# Altium schematic sheet УШЯИ.411618.029Э Э3 Лист 5new.schdoc
size 594 x 420 mm; SheetNumber: 5; SheetTotal: 7
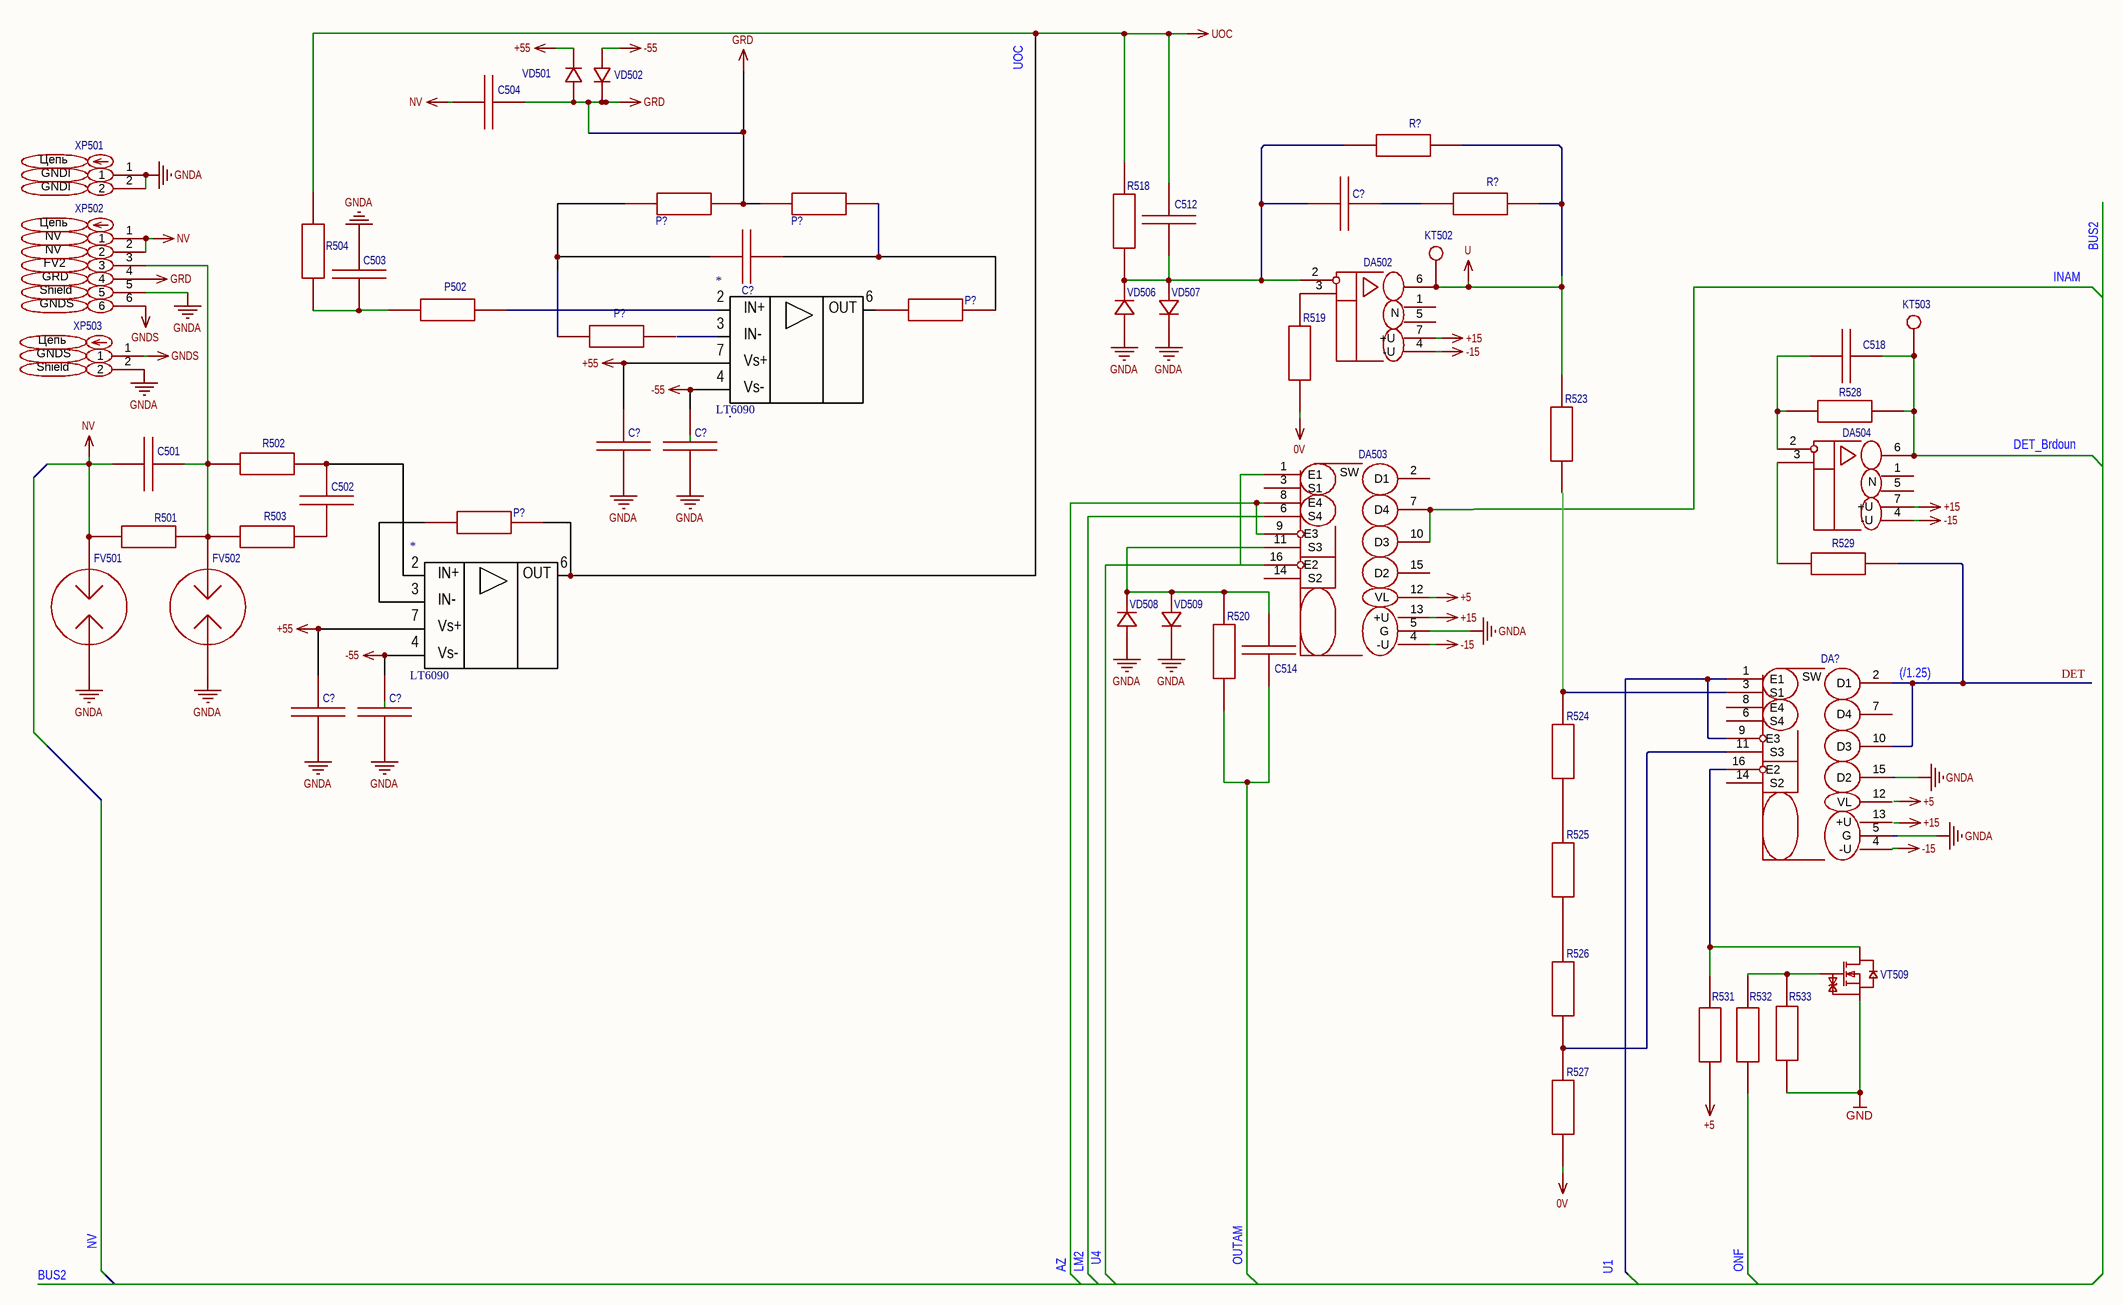
[diagram p0: УШЯИ.411618.029Э Э3 Лист 5new.schdoc]

## Parts
(Parts that share a designator on the sheet are numbered #1, #2 ... from top to bottom, then left to right.)
*#1  LT6090
*#2  LT6090
C501  Конденсатор К10-17Б М47 47пФ  NP0 5% [DIP]  [Конденсатор К10-17Б М47 X.X.xФ  NP0 5% [DIP 8мм]]  (value not drawn)
C502  Конденсатор К10-17Б М47 47пФ  NP0 5% [DIP]  [Конденсатор К10-17Б М47 X.X.xФ  NP0 5% [DIP 8мм]]  (value not drawn)
C503  Конденсатор SMD 10пФ 100В X7R 10% [0805]  [C0805]  (value not drawn)
C504  Конденсатор К10-17Б М47 0,022мкФ  NP0 5% [DIP]  [Конденсатор К10-17Б М47 X.X.xФ  NP0 5% [DIP 5мм]]  (value not drawn)
C512  Конденсатор SMD 10пФ 100В X7R 10% [0805]  [C0805]  (value not drawn)
C514  Конденсатор SMD 1500пФ 100В X7R 10% [0805]  [C0805]  (value not drawn)
C518  Конденсатор SMD 33пФ 100В X7R 10% [0805]  [C0805]  (value not drawn)
C?#1  Конденсатор SMD 100пФ 100В X7R 10% [0805]  [C0805]  (value not drawn)
C?#2  Конденсатор К10-17Б М47 47пФ  NP0 5% [DIP]  [Конденсатор К10-17Б М47 X.X.xФ  NP0 5% [DIP 8мм]]  (value not drawn)
C?#3  Конденсатор К10-17Б М47 47пФ  NP0 5% [DIP]  [Конденсатор К10-17Б М47 X.X.xФ  NP0 5% [DIP 8мм]]  (value not drawn)
C?#4  Конденсатор К10-17Б М47 47пФ  NP0 5% [DIP]  [Конденсатор К10-17Б М47 X.X.xФ  NP0 5% [DIP 8мм]]  (value not drawn)
C?#5  Конденсатор К10-17Б М47 47пФ  NP0 5% [DIP]  [Конденсатор К10-17Б М47 X.X.xФ  NP0 5% [DIP 8мм]]  (value not drawn)
C?#6  Конденсатор К10-17Б М47 47пФ  NP0 5% [DIP]  [Конденсатор К10-17Б М47 X.X.xФ  NP0 5% [DIP 8мм]]  (value not drawn)
DA502  Операционный усилитель ADA4627-1BRZ [SOIC-8]  [SOIC-8_L5.0-W4.0-P1.27-LS6.1-BL]  (value not drawn)
DA503  Коммутатор аналоговых сигналов ADG433BRZ [SOIC-16]  [SOIC-16_L9.9-W3.9-P1.27-LS6.0-BL]  (value not drawn)
DA504  Операционный усилитель ADA4627-1BRZ [SOIC-8]  [SOIC-8_L5.0-W4.0-P1.27-LS6.1-BL]  (value not drawn)
DA?  Коммутатор аналоговых сигналов ADG433BRZ [SOIC-16]  [SOIC-16_L9.9-W3.9-P1.27-LS6.0-BL]  (value not drawn)
FV501  Разрядник газонаполненный B88069-X8870-B502 (A81-C90X)  (value not drawn)
FV502  Разрядник газонаполненный B88069-X8870-B502 (A81-C90X)  (value not drawn)
KT502  Control point  (value not drawn)
KT503  Control point  (value not drawn)
P502  Перемычка  [R0805]  (value not drawn)
P?#1  Перемычка  [R0805]  (value not drawn)
P?#2  Перемычка  [R0805]  (value not drawn)
P?#3  Резистор 100Ом 0,25Вт 1% [1206]  [R0805]  (value not drawn)
P?#4  Перемычка  [R0805]  (value not drawn)
P?#5  Резистор 100Ом 0,25Вт 1% [1206]  [R0805]  (value not drawn)
R501  Резистор C2-29В-0,25 1,2кОм ±0,5% [DIP]  (value not drawn)
R502  Резистор C2-29В-0,25 301кОм ±0,5% [DIP]  (value not drawn)
R503  Резистор C2-29В-0,25 5.1кОм ±0,5% [DIP]  (value not drawn)
R504  Резистор 91кОм 0,125Вт 1% [0805]  [R0805]  (value not drawn)
R518  Резистор 40,2кОм 0.25Вт 1% [1206]  [R0805]  (value not drawn)
R519  Резистор 15кОм 0,125Вт 1% [0805]  [R0805]  (value not drawn)
R520  Резистор 200кОм 0,125Вт 1% [0805]  [R0805]  (value not drawn)
R523  Резистор 4,02кОм 0.25Вт 1% [1206]  [R1206]  (value not drawn)
R524  Резистор 4,02кОм 0.25Вт 1% [1206]  [R1206]  (value not drawn)
R525  Резистор 4,02кОм 0.25Вт 1% [1206]  [R1206]  (value not drawn)
R526  Резистор 4,02кОм 0.25Вт 1% [1206]  [R1206]  (value not drawn)
R527  Резистор 4,02кОм 0.25Вт 1% [1206]  [R1206]  (value not drawn)
R528  Резистор 3,6кОм 0,125Вт 1% [0805]  [R0805]  (value not drawn)
R529  Резистор 110кОм 0,125Вт 1% [0805]  [R0805]  (value not drawn)
R531  Резистор 5,3кОм 0,125Вт 1% [0805]  [R0805]  (value not drawn)
R532  Резистор 100Ом 0,125Вт 1% [0805]  [R0805]  (value not drawn)
R533  Резистор 100Ом 0,125Вт 1% [0805]  [R0805]  (value not drawn)
R?#1  Резистор 10кОм 0,125Вт 1% [0805]  [R0805]  (value not drawn)
R?#2  Резистор 10кОм 0,125Вт 1% [0805]  [R0805]  (value not drawn)
VD501  Диод импульсный 1N4448 [DO-35]  [DO-35_BD2.0-L4.2-P8.20-D0.5-RD]  (value not drawn)
VD502  Диод импульсный 1N4448 [DO-35]  [DO-35_BD2.0-L4.2-P8.20-D0.5-RD]  (value not drawn)
VD506  Диод импульсный 1N4448 [SOD-123]  [SOD-123_L2.7-W1.6-LS3.7-RD-1]  (value not drawn)
VD507  Диод импульсный 1N4448 [SOD-123]  [SOD-123_L2.7-W1.6-LS3.7-RD-1]  (value not drawn)
VD508  Диод импульсный 1N4448 [SOD-123]  [SOD-123_L2.7-W1.6-LS3.7-RD-1]  (value not drawn)
VD509  Диод импульсный 1N4448 [SOD-123]  [SOD-123_L2.7-W1.6-LS3.7-RD-1]  (value not drawn)
VT509  Транзистор полевой MOSFET N-канальный BSS138BK [SOT-23-3]  [SOT-23-3_L2.9-W1.3-P1.90-LS2.4-BR]  (value not drawn)
XP501  Вилка на плату 280370-2 шаг 2.54мм  [CONN-TH_280370-2]  (value not drawn)
XP502  Вилка на плату 280372-1 шаг 2.54мм  [CONN-TH_280372-1]  (value not drawn)
XP503  Вилка на плату 280370-2 шаг 2.54мм  [CONN-TH_280370-2]  (value not drawn)

## Nets
0V: R519.1 R527.1
+5: DA503.12(VL) R531.1
+15: DA502.7(+U) DA503.13(+U) DA504.7(+U)
+55: *#1.13 *#2.13 C?#3.1 C?#5.1 VD501.1
-15: DA502.4(-U) DA503.4(-U) DA504.4(-U)
-55: *#1.14 *#2.14 C?#4.1 C?#6.1 VD502.2
GND: R533.1 VT509.2(S)
GNDA: C503.2 C?#3.2 C?#4.2 C?#5.2 C?#6.2 DA503.5(G) DA?.5(G) DA?.15(D2) FV501.2 FV502.2 VD506.2(A) VD507.1(C) VD508.2(A) VD509.1(C) XP501.1 XP501.2 XP502.5 XP503.2
GNDS: XP502.6 XP503.1
GRD: C504.2 P?#1.1 P?#2.2 VD501.2 VD502.1 XP502.4
NV: C501.2 C504.1 FV501.1 R501.1 XP502.1 XP502.2
U: DA502.6(OUT) KT502.1 R523.2 R?#1.2 R?#2.2
UOC: *#2.7 C512.2 P?#5.1 R504.2 R518.1
AZ: DA503.8(E4) DA503.9(E3)
LM2: DA503.6(S4)
ONF: R532.1
OUTAM: C514.1 R520.2
U4: DA503.1(E1) DA503.16(E2)
Net*#1_7: *#1.7 P?#3.2
Net*#1_11: *#1.11 P502.1
Net*#2_11: *#2.11 C502.1 R502.2
Net*#2_12: *#2.12 P?#5.2
NetC501_1: C501.1 FV502.1 R501.2 R502.1 R503.1 XP502.3
NetC502_2: C502.2 R503.2
NetC503_1: C503.1 P502.2 R504.1
NetC512_1: C512.1 C?#1.2 DA502.2(-IN) R518.2 R?#1.1 VD506.1(C) VD507.2(A)
NetC514_2: C514.2 DA503.11(S3) R520.1 VD508.1(C) VD509.2(A)
NetC518_1: C518.1 DA504.2(-IN) R528.2
NetC518_2: C518.2 DA504.6(OUT) KT503.1 R528.1
NetC?#1_1: C?#1.1 R?#2.1
NetC?#2_1: C?#2.1 P?#1.2 P?#4.2
NetC?#2_2: C?#2.2 P?#2.1 P?#3.1
NetDA502_3: DA502.3(+IN) R519.2
NetDA503_7: DA503.7(D4) DA503.10(D3)
NetDA504_3: DA504.3(+IN) R529.2
NetDA?_1: DA?.1(E1) DA?.9(E3)
NetDA?_2: DA?.2(D1) DA?.10(D3) R529.1
NetDA?_3: DA?.3(S1) R523.1 R524.2
NetDA?_11: DA?.11(S3) R526.1 R527.2
NetDA?_16: DA?.16(E2) R531.2 VT509.3(D)
NetR524_1: R524.1 R525.2
NetR525_1: R525.1 R526.2
NetR532_2: R532.2 R533.2 VT509.1(G)

Not connected (* = marked no-connect by the designer): *#1 12; DA502 1(N) 5(N); DA503 2(D1) 3(S1) 14(S2) 15(D2); DA504 1(N) 5(N); DA? 4(-U) 6(S4) 7(D4) 8(E4) 12(VL) 13(+U) 14(S2); P?#4 1

## Buses and harness runs
bus BUS2

## Notes on the sheet
- GNDI
- NV
- GNDS
- (near XP502) Shield
- (near XP502) GRD
- (near XP502) FV2
- (near XP503) Shield
- Labels drawn without touching a wire or pin: (/1.25), DET, DET_Brdoun, INAM, U1, UOC
- Подп. и дата
- Инв.№ дубл.
- Взам.инв.№
- Подп.и дата
- Инв.№ подл.
- Изм.
- Лист
- № докум.
- Подп.
- Дата
- Формат  A2
- (in symbol LT6090) 2; 6; IN+; OUT; 3; IN-; Vs+; 4; Vs-
- (in symbol Вилка на плату 280370-2 шаг 2.54мм) Цепь
- (in symbol Вилка на плату 280372-1 шаг 2.54мм) Цепь
- (in symbol Коммутатор аналоговых сигналов ADG433BRZ [SOIC-16]) SW

## Library data of the parts
C501 = Конденсатор К10-17Б М47 47пФ  NP0 5% [DIP]: Contributor: jordanjin; Convert to PCB: yes; UniqueId: gge491fe3ed6471c83b; Origin Footprint: К10-17Б М47; Device: Конденсатор К10-17Б М47 47пФ  NP0 5% [DIP]; Symbol: Конденсатор К10-17Б М47 47пФ  NP0 5% [DIP]; Manufacturer Part: К10-17Б М47; Add into BOM: yes; spicePre: C; spiceSymbolName: Конденсатор К10-17Б М47 33пФ NP0 5% [DIP]
C502 C?#2-C?#6 = Конденсатор К10-17Б М47 47пФ  NP0 5% [DIP]: Contributor: jordanjin; Convert to PCB: yes; UniqueId: gge052eea8d6ff6ddb1; Origin Footprint: К10-17Б М47; Device: Конденсатор К10-17Б М47 47пФ  NP0 5% [DIP]; Symbol: Конденсатор К10-17Б М47 47пФ  NP0 5% [DIP]; Manufacturer Part: К10-17Б М47; Add into BOM: yes; spicePre: C; spiceSymbolName: Конденсатор К10-17Б М47 33пФ NP0 5% [DIP]
C503 = Конденсатор SMD 10пФ 100В X7R 10% [0805]: Contributor: jordanjin; Convert to PCB: yes; UniqueId: gge9d51e8d6ddafb28b; Origin Footprint: C0805; Device: Конденсатор SMD 10пФ 100В X7R 10% [0805]; Symbol: Конденсатор SMD 10пФ 100В X7R 10% [0805]; Manufacturer Part: C0805; Add into BOM: yes; spicePre: C; spiceSymbolName: Конденсатор SMD 100нФ 100В X7R 10% [0805]; FootprintName: C0805
C504 = Конденсатор К10-17Б М47 0,022мкФ  NP0 5% [DIP]: Contributor: jordanjin; Convert to PCB: yes; UniqueId: ggef415597d1a4119d4; Origin Footprint: К10-17Б М47; Device: Конденсатор К10-17Б М47 0,022мкФ  NP0 5% [DIP]; Symbol: Конденсатор К10-17Б М47 0,022мкФ  NP0 5% [DIP]; Manufacturer Part: К10-17Б М47; Add into BOM: yes; spicePre: C; spiceSymbolName: Конденсатор К10-17Б М47 33пФ NP0 5% [DIP]
C512 = Конденсатор SMD 10пФ 100В X7R 10% [0805]: Contributor: jordanjin; Convert to PCB: yes; UniqueId: ggebd9749fa172219f8; Origin Footprint: C0805; Device: Конденсатор SMD 10пФ 100В X7R 10% [0805]; Symbol: Конденсатор SMD 10пФ 100В X7R 10% [0805]; Manufacturer Part: C0805; Add into BOM: yes; spicePre: C; spiceSymbolName: Конденсатор SMD 100нФ 100В X7R 10% [0805]; FootprintName: C0805
C514 = Конденсатор SMD 1500пФ 100В X7R 10% [0805]: Contributor: jordanjin; Convert to PCB: yes; UniqueId: ggeffbae3697dc6129d; Origin Footprint: C0805; Device: Конденсатор SMD 1500пФ 100В X7R 10% [0805]; Symbol: Конденсатор SMD 1500пФ 100В X7R 10% [0805]; Manufacturer Part: C0805; Add into BOM: yes; spicePre: C; spiceSymbolName: Конденсатор SMD 100нФ 100В X7R 10% [0805]; FootprintName: C0805
C518 = Конденсатор SMD 33пФ 100В X7R 10% [0805]: Contributor: jordanjin; Convert to PCB: yes; UniqueId: ggeb634362126cd7a9d; Origin Footprint: C0805; Device: Конденсатор SMD 33пФ 100В X7R 10% [0805]; Symbol: Конденсатор SMD 33пФ 100В X7R 10% [0805]; Manufacturer Part: C0805; Add into BOM: yes; spicePre: C; spiceSymbolName: Конденсатор SMD 100нФ 100В X7R 10% [0805]; FootprintName: C0805
C?#1 = Конденсатор SMD 100пФ 100В X7R 10% [0805]: Contributor: jordanjin; Convert to PCB: yes; UniqueId: gge9bc8ec9642d03d6f; Origin Footprint: C0805; Device: Конденсатор SMD 100пФ 100В X7R 10% [0805]; Symbol: Конденсатор SMD 100пФ 100В X7R 10% [0805]; Manufacturer Part: C0805; Add into BOM: yes; spicePre: C; spiceSymbolName: Конденсатор SMD 100нФ 100В X7R 10% [0805]; FootprintName: C0805
DA502 = Операционный усилитель ADA4627-1BRZ [SOIC-8]: Manufacturer: Analog Devices; Contributor: jordanjin; Convert to PCB: yes; UniqueId: gge3bbaef5c86713b63; ModelId: 08ee08ca4db744298953d7a1ad16709b; Origin Footprint: SOIC-8_L5.0-W4.0-P1.27-LS6.1-BL; Device: Операционный усилитель ADA4627-1BRZ [SOIC-8]; Symbol: Операционный усилитель ADA4627-1BRZ [SOIC-8]; Supplier: LCSC; Manufacturer Part: ADA4627-1BRZ; JLCPCB Part Class: Extended Part; spicePre: D; spiceSymbolName: Операционный усилитель ADA4627-1BRZ [SOIC-8]; Add into BOM: yes; FootprintName: SOIC-8_L5.0-W4.0-P1.27-LS6.1-BL; ModelName: SOIC-8_L5.0-W4.0-P1.27-LS6.1-BL
DA503 DA? = Коммутатор аналоговых сигналов ADG433BRZ [SOIC-16]: Manufacturer: Analog Devices; Manufacturer Part: ADG433BRZ-REEL; Contributor: jordanjin; Convert to PCB: yes; UniqueId: gge812f241916226e6f; Origin Footprint: SOIC-16_L9.9-W3.9-P1.27-LS6.0-BL; Device: Коммутатор аналоговых сигналов ADG433BRZ [SOIC-16]; Symbol: Коммутатор аналоговых сигналов ADG433BRZ [SOIC-16]; Supplier: LCSC; Supplier Part: C655338; JLCPCB Part Class: Extended Part; spicePre: D; spiceSymbolName: Коммутатор аналоговых сигналов ADG433BRZ [SOIC-16]; Add into BOM: yes; FootprintName: SOIC-16_L9.9-W3.9-P1.27-LS6.0-BL
DA504 = Операционный усилитель ADA4627-1BRZ [SOIC-8]: Manufacturer: Analog Devices; Contributor: jordanjin; Convert to PCB: yes; UniqueId: gge3cb18010d39f84ed; ModelId: 08ee08ca4db744298953d7a1ad16709b; Origin Footprint: SOIC-8_L5.0-W4.0-P1.27-LS6.1-BL; Device: Операционный усилитель ADA4627-1BRZ [SOIC-8]; Symbol: Операционный усилитель ADA4627-1BRZ [SOIC-8]; Supplier: LCSC; Manufacturer Part: ADA4627-1BRZ; JLCPCB Part Class: Extended Part; spicePre: D; spiceSymbolName: Операционный усилитель ADA4627-1BRZ [SOIC-8]; Add into BOM: yes; FootprintName: SOIC-8_L5.0-W4.0-P1.27-LS6.1-BL; ModelName: SOIC-8_L5.0-W4.0-P1.27-LS6.1-BL
FV501 = Разрядник газонаполненный B88069-X8870-B502 (A81-C90X): Manufacturer: TDK/EPCOS; Contributor: jordanjin; Convert to PCB: yes; UniqueId: gge7d0c9ba83060bbcb; Origin Footprint: B88069-X8870-B502 (A81-C90X); Device: Разрядник газонаполненный B88069-X8870-B502 (A81-C90X); Symbol: Разрядник газонаполненный B88069-X8870-B502 (A81-C90X); Manufacturer Part: B88069-X8870-B502 (A81-C90X); spicePre: F; spiceSymbolName: Разрядник газонаполненный B88069-X8870-B502 (A81-C90X); Add into BOM: yes
FV502 = Разрядник газонаполненный B88069-X8870-B502 (A81-C90X): Manufacturer: TDK/EPCOS; Contributor: jordanjin; Convert to PCB: yes; UniqueId: gge3e96f04a3a81286c; Origin Footprint: B88069-X8870-B502 (A81-C90X); Device: Разрядник газонаполненный B88069-X8870-B502 (A81-C90X); Symbol: Разрядник газонаполненный B88069-X8870-B502 (A81-C90X); Manufacturer Part: B88069-X8870-B502 (A81-C90X); spicePre: F; spiceSymbolName: Разрядник газонаполненный B88069-X8870-B502 (A81-C90X); Add into BOM: yes
KT502 = Control point: Contributor: jordanjin; Convert to PCB: yes; UniqueId: gge744cfcad2b49a33b; Origin Footprint: CONTROL POINT; Device: Control point; Symbol: Control point; Manufacturer Part: Control point; spicePre: K; spiceSymbolName: Control point; Add into BOM: yes
KT503 = Control point: Contributor: jordanjin; Convert to PCB: yes; UniqueId: gge87ec17736d97cc32; Origin Footprint: CONTROL POINT; Device: Control point; Symbol: Control point; Manufacturer Part: Control point; spicePre: K; spiceSymbolName: Control point; Add into BOM: yes
P502 P?#4 = Перемычка: Contributor: jordanjin; Convert to PCB: yes; UniqueId: gge573c0a9b40f3e6e7; ModelId: de27d504f5024d53a3020ec2611f5e5e; Origin Footprint: R0805; Device: Перемычка; Symbol: Перемычка; Manufacturer Part: R0805; spicePre: R; spiceSymbolName: Резистор 12кОм 0,125Вт 1% [0805]; Add into BOM: yes; FootprintName: R0805; ModelName: R0805
P?#1 P?#2 = Перемычка: Contributor: jordanjin; Convert to PCB: yes; UniqueId: ggece0821aceddbed5f; ModelId: de27d504f5024d53a3020ec2611f5e5e; Origin Footprint: R0805; Device: Перемычка; Symbol: Перемычка; Manufacturer Part: R0805; spicePre: R; spiceSymbolName: Резистор 12кОм 0,125Вт 1% [0805]; Add into BOM: yes; FootprintName: R0805; ModelName: R0805
P?#3 P?#5 = Перемычка: Contributor: jordanjin; Convert to PCB: yes; UniqueId: gge82243ce5db2e3be1; ModelId: de27d504f5024d53a3020ec2611f5e5e; Origin Footprint: R0805; Device: Перемычка; Symbol: Перемычка; Manufacturer Part: R0805; spicePre: R; spiceSymbolName: Резистор 12кОм 0,125Вт 1% [0805]; Add into BOM: yes; FootprintName: R0805; ModelName: R0805
R501 = Резистор C2-29В-0,25 1,2кОм ±0,5% [DIP]: Contributor: jordanjin; Convert to PCB: yes; UniqueId: ggee93e24d1da7ce645; Origin Footprint: C2-29В-0,25; Device: Резистор C2-29В-0,25 1,2кОм ±0,5% [DIP]; Symbol: Резистор C2-29В-0,25 1,2кОм ±0,5% [DIP]; Manufacturer Part: C2-29В-0,25; spicePre: R; spiceSymbolName: Резистор C2-29В-0,25 1 МОм ±0,5% [DIP]; Add into BOM: yes
R502 = Резистор C2-29В-0,25 301кОм ±0,5% [DIP]: Contributor: jordanjin; Convert to PCB: yes; UniqueId: ggeaa02f2f272a77a31; Origin Footprint: C2-29В-0,25; Device: Резистор C2-29В-0,25 301кОм ±0,5% [DIP]; Symbol: Резистор C2-29В-0,25 301кОм ±0,5% [DIP]; Manufacturer Part: C2-29В-0,25; spicePre: R; spiceSymbolName: Резистор C2-29В-0,25 1 МОм ±0,5% [DIP]; Add into BOM: yes
R503 = Резистор C2-29В-0,25 5.1кОм ±0,5% [DIP]: Contributor: jordanjin; Convert to PCB: yes; UniqueId: gge30d652682c4d8343; Origin Footprint: C2-29В-0,25; Device: Резистор C2-29В-0,25 5.1кОм ±0,5% [DIP]; Symbol: Резистор C2-29В-0,25 5.1кОм ±0,5% [DIP]; Manufacturer Part: C2-29В-0,25; spicePre: R; spiceSymbolName: Резистор C2-29В-0,25 1 МОм ±0,5% [DIP]; Add into BOM: yes
R504 = Резистор 91кОм 0,125Вт 1% [0805]: Contributor: jordanjin; Convert to PCB: yes; UniqueId: ggeca5f87feb20cb38d; ModelId: de27d504f5024d53a3020ec2611f5e5e; Origin Footprint: R0805; Device: Резистор 91кОм 0,125Вт 1% [0805]; Symbol: Резистор 91кОм 0,125Вт 1% [0805]; Manufacturer Part: R0805; spicePre: R; spiceSymbolName: Резистор 12кОм 0,125Вт 1% [0805]; Add into BOM: yes; FootprintName: R0805; ModelName: R0805
R518 = Резистор 40,2кОм 0.25Вт 1% [1206]: Contributor: jordanjin; Convert to PCB: yes; UniqueId: gge080981316cda412b; ModelId: de27d504f5024d53a3020ec2611f5e5e; Origin Footprint: R0805; Device: Резистор 40,2кОм 0.25Вт 1% [1206]; Symbol: Резистор 40,2кОм 0.25Вт 1% [1206]; Manufacturer Part: R0805; spicePre: R; spiceSymbolName: Резистор 12кОм 0,125Вт 1% [0805]; Add into BOM: yes; FootprintName: R0805; ModelName: R0805
R519 = Резистор 15кОм 0,125Вт 1% [0805]: Contributor: jordanjin; Convert to PCB: yes; UniqueId: ggee26b7d08d16a2d39; ModelId: de27d504f5024d53a3020ec2611f5e5e; Origin Footprint: R0805; Device: Резистор 15кОм 0,125Вт 1% [0805]; Symbol: Резистор 15кОм 0,125Вт 1% [0805]; Manufacturer Part: R0805; spicePre: R; spiceSymbolName: Резистор 12кОм 0,125Вт 1% [0805]; Add into BOM: yes; FootprintName: R0805; ModelName: R0805
R520 = Резистор 200кОм 0,125Вт 1% [0805]: Contributor: jordanjin; Convert to PCB: yes; UniqueId: gge3d1eef37f3680d67; ModelId: de27d504f5024d53a3020ec2611f5e5e; Origin Footprint: R0805; Device: Резистор 200кОм 0,125Вт 1% [0805]; Symbol: Резистор 200кОм 0,125Вт 1% [0805]; Manufacturer Part: R0805; spicePre: R; spiceSymbolName: Резистор 12кОм 0,125Вт 1% [0805]; Add into BOM: yes; FootprintName: R0805; ModelName: R0805
R523 = Резистор 4,02кОм 0.25Вт 1% [1206]: Contributor: jordanjin; Convert to PCB: yes; UniqueId: gge14753fe53ea0679b; Origin Footprint: R1206; Device: Резистор 4,02кОм 0.25Вт 1% [1206]; Symbol: Резистор 4,02кОм 0.25Вт 1% [1206]; Manufacturer Part: R1206; spicePre: R; spiceSymbolName: Резистор 12кОм 0,25Вт 1% [1206]; Add into BOM: yes; FootprintName: R1206
R524 = Резистор 4,02кОм 0.25Вт 1% [1206]: Contributor: jordanjin; Convert to PCB: yes; UniqueId: gge013a5ba9a346bf91; Origin Footprint: R1206; Device: Резистор 4,02кОм 0.25Вт 1% [1206]; Symbol: Резистор 4,02кОм 0.25Вт 1% [1206]; Manufacturer Part: R1206; spicePre: R; spiceSymbolName: Резистор 12кОм 0,25Вт 1% [1206]; Add into BOM: yes; FootprintName: R1206
R525 = Резистор 4,02кОм 0.25Вт 1% [1206]: Contributor: jordanjin; Convert to PCB: yes; UniqueId: ggeee7ff1649821f986; Origin Footprint: R1206; Device: Резистор 4,02кОм 0.25Вт 1% [1206]; Symbol: Резистор 4,02кОм 0.25Вт 1% [1206]; Manufacturer Part: R1206; spicePre: R; spiceSymbolName: Резистор 12кОм 0,25Вт 1% [1206]; Add into BOM: yes; FootprintName: R1206
R526 = Резистор 4,02кОм 0.25Вт 1% [1206]: Contributor: jordanjin; Convert to PCB: yes; UniqueId: gge439789adcec64be8; Origin Footprint: R1206; Device: Резистор 4,02кОм 0.25Вт 1% [1206]; Symbol: Резистор 4,02кОм 0.25Вт 1% [1206]; Manufacturer Part: R1206; spicePre: R; spiceSymbolName: Резистор 12кОм 0,25Вт 1% [1206]; Add into BOM: yes; FootprintName: R1206
R527 = Резистор 4,02кОм 0.25Вт 1% [1206]: Contributor: jordanjin; Convert to PCB: yes; UniqueId: gge8942019ccbc340b8; Origin Footprint: R1206; Device: Резистор 4,02кОм 0.25Вт 1% [1206]; Symbol: Резистор 4,02кОм 0.25Вт 1% [1206]; Manufacturer Part: R1206; spicePre: R; spiceSymbolName: Резистор 12кОм 0,25Вт 1% [1206]; Add into BOM: yes; FootprintName: R1206
R528 = Резистор 3,6кОм 0,125Вт 1% [0805]: Contributor: jordanjin; Convert to PCB: yes; UniqueId: gge6ded2c844e8eef63; ModelId: de27d504f5024d53a3020ec2611f5e5e; Origin Footprint: R0805; Device: Резистор 3,6кОм 0,125Вт 1% [0805]; Symbol: Резистор 3,6кОм 0,125Вт 1% [0805]; Manufacturer Part: R0805; spicePre: R; spiceSymbolName: Резистор 12кОм 0,125Вт 1% [0805]; Add into BOM: yes; FootprintName: R0805; ModelName: R0805
R529 = Резистор 110кОм 0,125Вт 1% [0805]: Contributor: jordanjin; Convert to PCB: yes; UniqueId: gge0039357b24a0ea0d; ModelId: de27d504f5024d53a3020ec2611f5e5e; Origin Footprint: R0805; Device: Резистор 110кОм 0,125Вт 1% [0805]; Symbol: Резистор 110кОм 0,125Вт 1% [0805]; Manufacturer Part: R0805; spicePre: R; spiceSymbolName: Резистор 12кОм 0,125Вт 1% [0805]; Add into BOM: yes; FootprintName: R0805; ModelName: R0805
R531 = Резистор 5,3кОм 0,125Вт 1% [0805]: Contributor: jordanjin; Convert to PCB: yes; UniqueId: ggedcd3b63f08ea3a0a; ModelId: de27d504f5024d53a3020ec2611f5e5e; Origin Footprint: R0805; Device: Резистор 5,3кОм 0,125Вт 1% [0805]; Symbol: Резистор 5,3кОм 0,125Вт 1% [0805]; Manufacturer Part: R0805; spicePre: R; spiceSymbolName: Резистор 100Ом 0,125Вт 1% [DIP]; Add into BOM: yes; FootprintName: R0805; ModelName: R0805
R532 = Резистор 100Ом 0,125Вт 1% [0805]: Contributor: jordanjin; Convert to PCB: yes; UniqueId: ggefe2e8d04342d3d3a; ModelId: de27d504f5024d53a3020ec2611f5e5e; Origin Footprint: R0805; Device: Резистор 100Ом 0,125Вт 1% [0805]; Symbol: Резистор 100Ом 0,125Вт 1% [0805]; Manufacturer Part: R0805; spicePre: R; spiceSymbolName: Резистор 100Ом 0,125Вт 1% [DIP]; Add into BOM: yes; FootprintName: R0805; ModelName: R0805
R533 = Резистор 100Ом 0,125Вт 1% [0805]: Contributor: jordanjin; Convert to PCB: yes; UniqueId: ggebf665dc4c1a49d6f; ModelId: de27d504f5024d53a3020ec2611f5e5e; Origin Footprint: R0805; Device: Резистор 100Ом 0,125Вт 1% [0805]; Symbol: Резистор 100Ом 0,125Вт 1% [0805]; Manufacturer Part: R0805; spicePre: R; spiceSymbolName: Резистор 100Ом 0,125Вт 1% [DIP]; Add into BOM: yes; FootprintName: R0805; ModelName: R0805
R?#1 R?#2 = Резистор 10кОм 0,125Вт 1% [0805]: Contributor: jordanjin; Convert to PCB: yes; UniqueId: gge1f9880c1a99a26b6; ModelId: de27d504f5024d53a3020ec2611f5e5e; Origin Footprint: R0805; Device: Резистор 10кОм 0,125Вт 1% [0805]; Symbol: Резистор 10кОм 0,125Вт 1% [0805]; Manufacturer Part: R0805; spicePre: R; spiceSymbolName: Резистор 12кОм 0,125Вт 1% [0805]; Add into BOM: yes; FootprintName: R0805; ModelName: R0805
VD501 = Диод импульсный 1N4448 [DO-35]: Manufacturer: onsemi; Manufacturer Part: 1N4448TR; Contributor: jordanjin; Convert to PCB: yes; UniqueId: ggedb55a1684d499d8c; Origin Footprint: DO-35_BD2.0-L4.2-P8.20-D0.5-RD; Device: Диод импульсный 1N4448 [DO-35]; Symbol: Диод импульсный 1N4448 [DO-35]; Supplier: LCSC; JLCPCB Part Class: Extended Part; spicePre: V; spiceSymbolName: Диод импульсный 1N4448 [DO-35]; Add into BOM: yes; FootprintName: DO-35_BD2.0-L4.2-P8.20-D0.5-RD
VD502 = Диод импульсный 1N4448 [DO-35]: Manufacturer: onsemi; Manufacturer Part: 1N4448TR; Contributor: jordanjin; Convert to PCB: yes; UniqueId: gged01192bb1f9db9d4; Origin Footprint: DO-35_BD2.0-L4.2-P8.20-D0.5-RD; Device: Диод импульсный 1N4448 [DO-35]; Symbol: Диод импульсный 1N4448 [DO-35]; Supplier: LCSC; JLCPCB Part Class: Extended Part; spicePre: V; spiceSymbolName: Диод импульсный 1N4448 [DO-35]; Add into BOM: yes; FootprintName: DO-35_BD2.0-L4.2-P8.20-D0.5-RD
VD506 = Диод импульсный 1N4448 [SOD-123]: Manufacturer: YANGJIE; Manufacturer Part: 1N4448WQ; Contributor: jordanjin; Convert to PCB: yes; UniqueId: gge2164371196df01db; ModelId: 5a61cd31046d4447ba73169a45a0935b; Origin Footprint: SOD-123_L2.7-W1.6-LS3.7-RD-1; Device: Диод импульсный 1N4448 [SOD-123]; Symbol: Диод импульсный 1N4448 [SOD-123]; Supplier: LCSC; JLCPCB Part Class: Extended Part; spicePre: V; spiceSymbolName: Диод импульсный 1N4448 [SOD-123]; Add into BOM: yes; FootprintName: SOD-123_L2.7-W1.6-LS3.7-RD-1; ModelName: SOD-123_L2.7-W1.6-LS3.7-RD-1
VD507 = Диод импульсный 1N4448 [SOD-123]: Manufacturer: YANGJIE; Manufacturer Part: 1N4448WQ; Contributor: jordanjin; Convert to PCB: yes; UniqueId: ggeefad4db6c371818c; ModelId: 5a61cd31046d4447ba73169a45a0935b; Origin Footprint: SOD-123_L2.7-W1.6-LS3.7-RD-1; Device: Диод импульсный 1N4448 [SOD-123]; Symbol: Диод импульсный 1N4448 [SOD-123]; Supplier: LCSC; JLCPCB Part Class: Extended Part; spicePre: V; spiceSymbolName: Диод импульсный 1N4448 [SOD-123]; Add into BOM: yes; FootprintName: SOD-123_L2.7-W1.6-LS3.7-RD-1; ModelName: SOD-123_L2.7-W1.6-LS3.7-RD-1
VD508 = Диод импульсный 1N4448 [SOD-123]: Manufacturer: YANGJIE; Manufacturer Part: 1N4448WQ; Contributor: jordanjin; Convert to PCB: yes; UniqueId: ggeb2fc8e63b166ca07; ModelId: 5a61cd31046d4447ba73169a45a0935b; Origin Footprint: SOD-123_L2.7-W1.6-LS3.7-RD-1; Device: Диод импульсный 1N4448 [SOD-123]; Symbol: Диод импульсный 1N4448 [SOD-123]; Supplier: LCSC; JLCPCB Part Class: Extended Part; spicePre: V; spiceSymbolName: Диод импульсный 1N4448 [SOD-123]; Add into BOM: yes; FootprintName: SOD-123_L2.7-W1.6-LS3.7-RD-1; ModelName: SOD-123_L2.7-W1.6-LS3.7-RD-1
VD509 = Диод импульсный 1N4448 [SOD-123]: Manufacturer: YANGJIE; Manufacturer Part: 1N4448WQ; Contributor: jordanjin; Convert to PCB: yes; UniqueId: gge65a38267476bf464; ModelId: 5a61cd31046d4447ba73169a45a0935b; Origin Footprint: SOD-123_L2.7-W1.6-LS3.7-RD-1; Device: Диод импульсный 1N4448 [SOD-123]; Symbol: Диод импульсный 1N4448 [SOD-123]; Supplier: LCSC; JLCPCB Part Class: Extended Part; spicePre: V; spiceSymbolName: Диод импульсный 1N4448 [SOD-123]; Add into BOM: yes; FootprintName: SOD-123_L2.7-W1.6-LS3.7-RD-1; ModelName: SOD-123_L2.7-W1.6-LS3.7-RD-1
VT509 = Транзистор полевой MOSFET N-канальный BSS138BK [SOT-23-3]: Manufacturer: ElecSuper(静芯); Contributor: lcsc; Convert to PCB: yes; UniqueId: ggef226161c5922261b; Origin Footprint: SOT-23-3_L2.9-W1.3-P1.90-LS2.4-BR; Device: Транзистор полевой MOSFET N-канальный BSS138BK [SOT-23-3]; Symbol: Транзистор полевой MOSFET N-канальный BSS138BK [SOT-23-3]; Supplier: LCSC; Supplier Part: C5224267; Manufacturer Part: BSS138BK; JLCPCB Part Class: Extended Part; spicePre: Q; spiceSymbolName: BSS138BK; Add into BOM: yes; FootprintName: SOT-23-3_L2.9-W1.3-P1.90-LS2.4-BR
XP501 = Вилка на плату 280370-2 шаг 2.54мм: Manufacturer: TE Connectivity; Contributor: jordanjin; Convert to PCB: yes; UniqueId: ggeb59dbef3022bc048; ModelId: 52348b5124d84a51b365c609ac2689aa; Origin Footprint: CONN-TH_280370-2; Device: Вилка на плату 280370-2 шаг 2.54мм; Symbol: Вилка на плату 280370-2 шаг 2.54мм; Supplier: LCSC; Manufacturer Part: 280370-2; JLCPCB Part Class: Extended Part; spicePre: X; spiceSymbolName: Вилка на плату 280370-2 шаг 2.54мм; Add into BOM: yes; FootprintName: CONN-TH_280370-2; ModelName: CONN-TH_280370-2
XP502 = Вилка на плату 280372-1 шаг 2.54мм: Manufacturer: TE Connectivity; Contributor: jordanjin; Convert to PCB: yes; UniqueId: gge7ae518aaf1173b8f; ModelId: 49da86841be14b909aa4008686c699c8; Origin Footprint: CONN-TH_280372-1; Device: Вилка на плату 280372-1 шаг 2.54мм; Symbol: Вилка на плату 280372-1 шаг 2.54мм; Supplier: LCSC; Manufacturer Part: 280372-1; JLCPCB Part Class: Extended Part; spicePre: X; spiceSymbolName: Вилка на плату 280372-1 шаг 2.54мм; Add into BOM: yes; FootprintName: CONN-TH_280372-1; ModelName: CONN-TH_280372-1
XP503 = Вилка на плату 280370-2 шаг 2.54мм: Manufacturer: TE Connectivity; Contributor: jordanjin; Convert to PCB: yes; UniqueId: ggee357d5eeee952ca0; ModelId: 52348b5124d84a51b365c609ac2689aa; Origin Footprint: CONN-TH_280370-2; Device: Вилка на плату 280370-2 шаг 2.54мм; Symbol: Вилка на плату 280370-2 шаг 2.54мм; Supplier: LCSC; Manufacturer Part: 280370-2; JLCPCB Part Class: Extended Part; spicePre: X; spiceSymbolName: Вилка на плату 280370-2 шаг 2.54мм; Add into BOM: yes; FootprintName: CONN-TH_280370-2; ModelName: CONN-TH_280370-2